# Altium schematic sheet Power_Section.SchDoc
size A4; DocumentNumber: 2; SheetNumber: 2; SheetTotal: 9
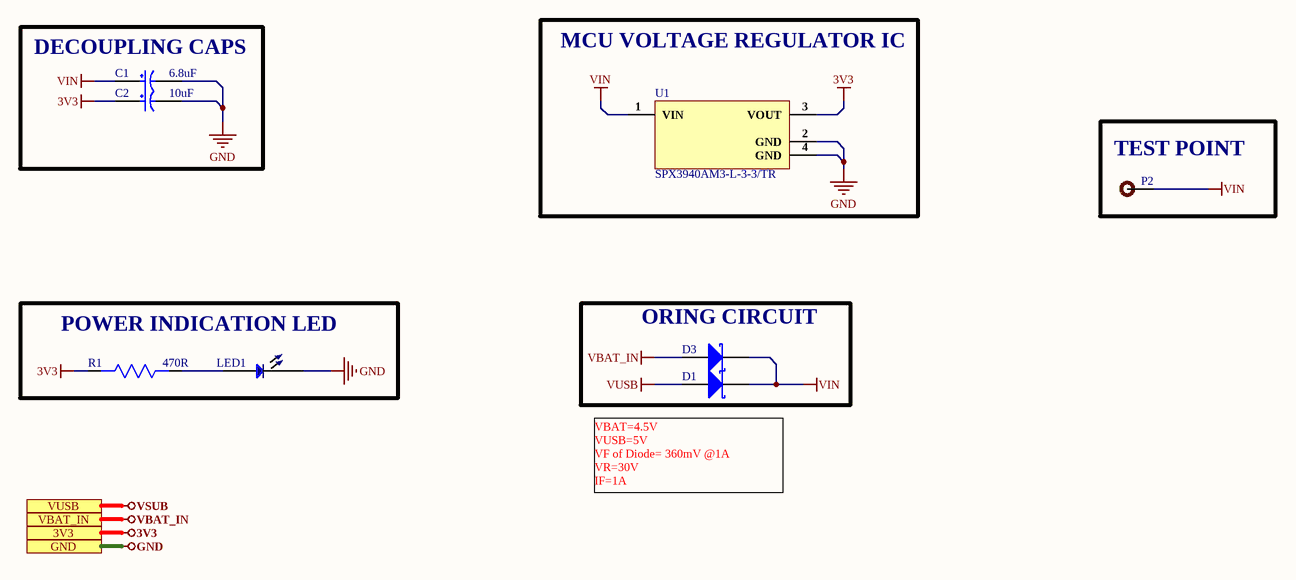
[diagram p0: Power_Section.SchDoc]

## Parts
C1  6.8uF  [EEEHB1E6R8R]
C2  10uF  [RVT1E100M0405]
D1  PMEG3010ER,115  [SOD123W]  (value not drawn)
D3  PMEG3010ER,115  [SOD123W]  (value not drawn)
LED1  TJ-S1005SW4TGLC2R-A5  [LED 0402]  (value not drawn)
P2  TEST POINT  [TEST POINT]  (value not drawn)
R1  470R  [Res0402]
U1  SPX3940AM3-L-3-3/TR  [SPX3940AM3-L-3-3/TR]

## Blocks framed on the sheet
DECOUPLING CAPS: C1 C2
MCU VOLTAGE REGULATOR IC: U1
TEST POINT: P2
POWER INDICATION LED: LED1 R1
ORING CIRCUIT: D1 D3

## Ports
3V3, GND, VBAT_IN, VUSB

## Nets
3V3: C2.1 R1.2 U1.3(VOUT) ; port 3V3
GND: C1.2 C2.2 LED1.2 U1.2(GND) U1.4(GND) ; port GND
VBAT_IN: D3.A ; port VBAT_IN
VIN: C1.1 D1.K D3.K P2.1 U1.1(VIN)
VSUB: port VUSB
VUSB: D1.A
NetLED1_1: LED1.1 R1.1

## Notes on the sheet
- (near D1) VBAT=4.5V
  VUSB=5V
  VF of Diode= 360mV @1A
  VR=30V
  IF=1A
- 1
- Huzaifa Ali

## Library data of the parts
C1 = EEEHB1E6R8R: CAP ALUM 6.8UF 20% 25V SMD; Manufacturer: Panasonic; Manufacturer Part Number: EEE-HB1E6R8R; Ripple Current: 25mA; Polarity: Polar; Life (Hours): 2000Hour; Leakage Current: 3uA; Supplier 1: Digi-Key; RoHS: Yes; Category: Aluminum Electrolytic Capacitors; Stock 1: 1546; Pricing 1: 1=0.43000, 10=0.29300, 50=0.19560, 100=0.16620, 500=0.11730, 1000=0.10264 (USD); Mount: Surface Mount,PCB; Case/Package: Radial; Min Operating Temperature: -40°C; Max Operating Temperature: 105°C; Capacitance: 6.8uF; Tolerance: 20%; Voltage Rating: 25V; Ripple Current (AC): 25mA; Packaging: Tape and Reel; Voltage Rating (DC): 25V; Package Quantity: 2000; Termination: SMD/SMT; Voltage: 25V; Series: HB; Construction: Cylindrical; Diameter: 4mm; Length: 5.5mm; Width: 650um; Height: 5.8mm; Height - Seated (Max): 0.228inch; Radiation Hardening: No; REACH SVHC: Unknown; Lead Free: Lead Free; RoHS Compliant: Yes; ComponentLink1URL: https://datasheet.ciiva.com/11784/0900766b806bc524-11784635.pdf?src-supplier=RSComponents; ComponentLink1Description: https://datasheet.ciiva.com/11784/0900766b806bc524-11784635.pdf?src-supplier=RSComponents; ComponentLink2URL: https://datasheet.ciiva.com/7903/1790623-7903207.pdf?src-supplier=Element14; ComponentLink2Description: https://datasheet.ciiva.com/7903/1790623-7903207.pdf?src-supplier=Element14; ComponentLink3URL: https://datasheet.ciiva.com/14592/70068251-14592830.pdf?src-supplier=Allied+Electronics; ComponentLink3Description: https://datasheet.ciiva.com/14592/70068251-14592830.pdf?src-supplier=Allied+Electronics; ComponentLink4URL: https://datasheet.ciiva.com/14596/70068251-14596488.pdf?src-supplier=Allied+Electronics; ComponentLink4Description: https://datasheet.ciiva.com/14596/70068251-14596488.pdf?src-supplier=Allied+Electronics; ComponentLink5URL: https://datasheet.ciiva.com/11681/aba0000ce4-11681133.pdf?src-supplier=Avnet; ComponentLink5Description: https://datasheet.ciiva.com/11681/aba0000ce4-11681133.pdf?src-supplier=Avnet; ComponentLink6URL: https://datasheet.ciiva.com/30226/16aba0000ce4-30226095.pdf?src-supplier=Onlinecomponents.com; ComponentLink6Description: https://datasheet.ciiva.com/30226/16aba0000ce4-30226095.pdf?src-supplier=Onlinecomponents.com; Supplier Part Number 1: PCE4142CT-ND
C2 = RVT1E100M0405: CAP ALUM 10uF 25V SMD; Manufacturer: ROQANG; φD: 4mm; L: 5.4mm; Tolerance: ±20%; Operating Temperature: -45℃~+105℃; Rated Voltage: 25V; Capacitance: 10uF
D1 D3 = PMEG3010ER,115: DIODE SCHOTTKY 30V 1A SOD123W; Manufacturer: Nexperia; Supplier 1: Digi-Key; Manufacturer Part Number: PMEG3010ER,115; Stock 1: 75070; Pricing 1: 1=0.36, 10=0.29, 100=0.1669, 500=0.1545, 1000=0.10506 (USD); Supplier Part Number 1: 1727-5201-1-ND
LED1 = TJ-S1005SW4TGLC2R-A5: Red 625nm 0402 Light Emitting Diodes (LED) RoHS; Manufacturer: TOGIALED; Manufacturer Part No: TJ-S1005SW4TGLC2R-A5; Package: 0402
P2 = TEST POINT: Test Point ON
R1 = RTT02471JTH: 470 ±5% 1/16W ±100ppm/°C 0402 Chip Resistor - Surface Mount RoHS; Manufacturer: RALEC; Manufacturer Part No: RTT02471JTH; Package: 0402; Value: 470R
U1 = SPX3940AM3-L-3-3/TR: IC REG LDO 3.3V 1A SOT223; Manufacturer: Exar; Max Input Voltage: 16V; Dropout Voltage: 280mV; Number of Outputs: 1; Min Input Voltage: 3.1V; Polarity: Positive; Quiescent Current: 25mA; Output Voltage Accuracy: 1%; Supplier 1: Mouser; Manufacturer Part Number: SPX3940AM3-L-3-3/TR; RoHS: Yes; Category: Voltage Regulators - Linear; Mount: Surface Mount; Case/Package: SOT-223; Number of Pins: 4; Min Operating Temperature: -40°C; Max Operating Temperature: 125°C; Packaging: Tape and Reel; Output Current: 1A; Max Output Current: 1A; Output Voltage: 3.3V; Min Output Voltage: 3.3V; RoHS Compliant: Yes; Lead Free: Lead Free; ComponentLink1URL: https://datasheet.ciiva.com/2057/spx3940-ds-r100-022912-2057339.pdf?src-supplier=Digi-Key; ComponentLink1Description: https://datasheet.ciiva.com/2057/spx3940-ds-r100-022912-2057339.pdf?src-supplier=Digi-Key; ComponentLink2URL: https://datasheet.ciiva.com/16386/spx3940-series-16386634.pdf?src-supplier=Future+Electronics; ComponentLink2Description: https://datasheet.ciiva.com/16386/spx3940-series-16386634.pdf?src-supplier=Future+Electronics; Supplier Part Number 1: 701-SPX3940AM3-L33TR